# Altium schematic sheet main.SchDoc
size A4; SheetNumber: 1; SheetTotal: 4
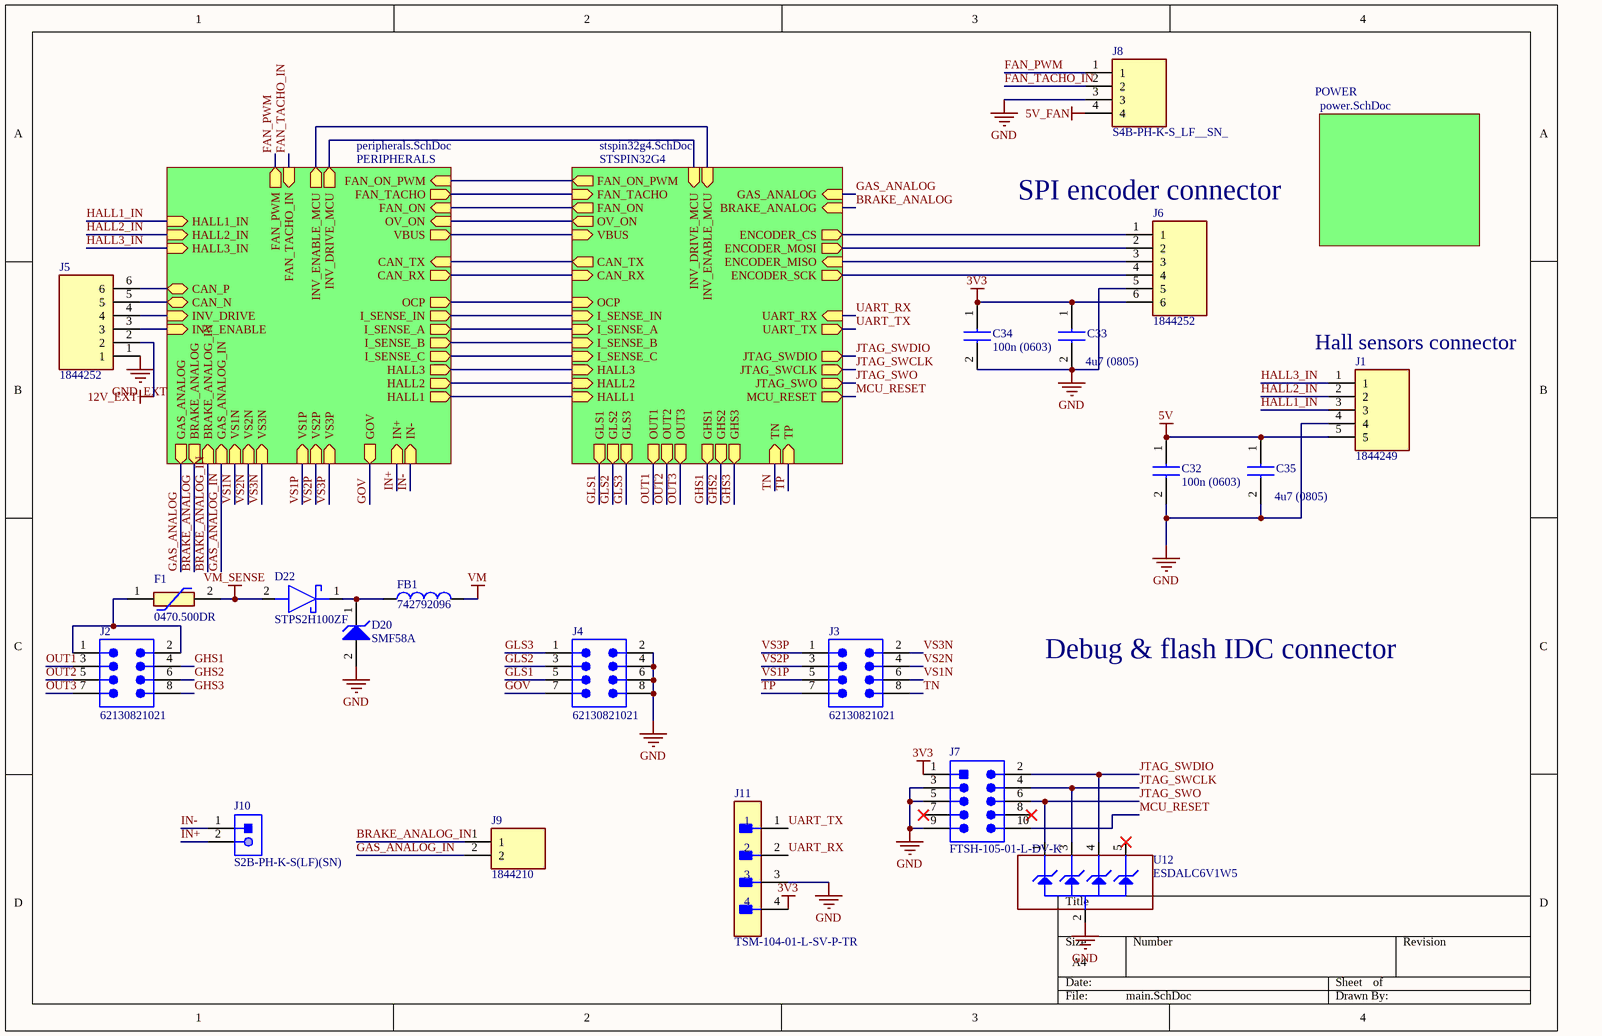
[diagram p0: main.SchDoc]

## Parts
C32  100n (0603)  [C0603]
C33  4u7 (0805)  [C0805]
C34  100n (0603)  [C0603]
C35  4u7 (0805)  [C0805]
D20  SMF58A  [ONSC-SOD-123FL-2-498_V]
D22  STPS2H100ZF  [SODFL3516X110N]
F1  0470.500DR  [1206L075132WR]
FB1  742792096  [WE-CBF_0805_L2W1.2H0.9_HC]
J1  1844249  [SHDRRA5W80P0X350_1X5_1890X920X825P]
J2  62130821021  [62130821021]
J3  62130821021  [62130821021]
J4  62130821021  [62130821021]
J5  1844252  [SHDRRA6W83P0X350_1X6_2240X920X825P]
J6  1844252  [SHDRRA6W83P0X350_1X6_2240X920X825P]
J7  FTSH-105-01-L-DV-K  [SMTC-FTSH-105-01-L-DV-K_V]
J8  S4B-PH-K-S_LF__SN_  [SHDRRA4W50P0X200_1X4_990X760X480P]
J9  1844210  [SHDRRA2W80P0X350_1X2_840X920X825P]
J10  S2B-PH-K-S(LF)(SN)  [JST-S2B-PH-K-S_V]
J11  TSM-104-01-L-SV-P-TR  [FP-TSM-104-01-L-SV-P-TR-MFG]
U12  ESDALC6V1W5  [ESDALC6V1W5]

## Sub-sheets
PERIPHERALS = peripherals.SchDoc: CAN_TX (in), CAN_RX (out), CAN_P (bidir), CAN_N (bidir), VS3N (in), VS2N (in), VS1N (in), VS1P (in), VS2P (in), VS3P (in), I_SENSE_A (out), I_SENSE_B (out), I_SENSE_C (out), I_SENSE_IN (out), OCP (out), VBUS (out), HALL1_IN (in), HALL2_IN (in), HALL3_IN (in), HALL1 (out), HALL2 (out), HALL3 (out), GOV (out), OV_ON (in), FAN_PWM (out), FAN_ON (in), FAN_ON_PWM (in), FAN_TACHO (out), FAN_TACHO_IN (in), IN- (in), IN+ (in), INV_DRIVE (in), INV_ENABLE (in), INV_DRIVE_MCU (out), INV_ENABLE_MCU (out), GAS_ANALOG (out), BRAKE_ANALOG (out), BRAKE_ANALOG_IN (in), GAS_ANALOG_IN (in)
POWER = power.SchDoc: no entries
STSPIN32G4 = stspin32g4.SchDoc: CAN_TX (out), CAN_RX (in), GHS1 (out), GHS2 (out), GHS3 (out), GLS3 (out), GLS2 (out), GLS1 (out), OUT1 (out), OUT2 (out), OUT3 (out), I_SENSE_A (in), I_SENSE_B (in), I_SENSE_C (in), OCP (in), VBUS (in), HALL3 (in), HALL2 (in), HALL1 (in), TN (in), TP (in), MCU_RESET (out), ENCODER_CS (out), ENCODER_SCK (out), ENCODER_MISO (in), ENCODER_MOSI (out), JTAG_SWDIO (out), JTAG_SWCLK (out), JTAG_SWO (out), UART_RX (in), UART_TX (out), I_SENSE_IN (in), OV_ON (out), GAS_ANALOG (in), BRAKE_ANALOG (in), FAN_ON_PWM (out), FAN_TACHO (in), FAN_ON (out), INV_DRIVE_MCU (in), INV_ENABLE_MCU (in)

## Nets
3V3: C33.1 C34.1 J6.6 J7.1 J11.4
5V: C32.1 C35.1 J1.5
5V_FAN: J8.4
12V_EXT: J5.2
GND: C32.2 C33.2 C34.2 C35.2 D20.2(A) J1.4 J4.2 J4.4 J4.6 J4.8 J6.5 J7.3 J7.5 J7.9 J8.3 J11.3 U12.2(GND)
GND_EXT: J5.1
VM: FB1.2
VM_SENSE: D22.2(A) F1.2
BRAKE_ANALOG: sheet PERIPHERALS/BRAKE_ANALOG, sheet STSPIN32G4/BRAKE_ANALOG
BRAKE_ANALOG_IN: J9.1 ; sheet PERIPHERALS/BRAKE_ANALOG_IN
FAN_PWM: J8.1 ; sheet PERIPHERALS/FAN_PWM
FAN_TACHO_IN: J8.2 ; sheet PERIPHERALS/FAN_TACHO_IN
GAS_ANALOG: sheet PERIPHERALS/GAS_ANALOG, sheet STSPIN32G4/GAS_ANALOG
GAS_ANALOG_IN: J9.2 ; sheet PERIPHERALS/GAS_ANALOG_IN
GHS1: J2.4 ; sheet STSPIN32G4/GHS1
GHS2: J2.6 ; sheet STSPIN32G4/GHS2
GHS3: J2.8 ; sheet STSPIN32G4/GHS3
GLS1: J4.5 ; sheet STSPIN32G4/GLS1
GLS2: J4.3 ; sheet STSPIN32G4/GLS2
GLS3: J4.1 ; sheet STSPIN32G4/GLS3
GOV: J4.7 ; sheet PERIPHERALS/GOV
HALL1_IN: J1.3 ; sheet PERIPHERALS/HALL1_IN
HALL2_IN: J1.2 ; sheet PERIPHERALS/HALL2_IN
HALL3_IN: J1.1 ; sheet PERIPHERALS/HALL3_IN
IN+: J10.2 ; sheet PERIPHERALS/IN+
IN-: J10.1 ; sheet PERIPHERALS/IN-
JTAG_SWCLK: J7.4 U12.3(IO2) ; sheet STSPIN32G4/JTAG_SWCLK
JTAG_SWDIO: J7.2 U12.4(IO3) ; sheet STSPIN32G4/JTAG_SWDIO
JTAG_SWO: J7.6 U12.1(IO1) ; sheet STSPIN32G4/JTAG_SWO
MCU_RESET: J7.10 ; sheet STSPIN32G4/MCU_RESET
OUT1: J2.3 ; sheet STSPIN32G4/OUT1
OUT2: J2.5 ; sheet STSPIN32G4/OUT2
OUT3: J2.7 ; sheet STSPIN32G4/OUT3
TN: J3.8 ; sheet STSPIN32G4/TN
TP: J3.7 ; sheet STSPIN32G4/TP
UART_RX: J11.2 ; sheet STSPIN32G4/UART_RX
UART_TX: J11.1 ; sheet STSPIN32G4/UART_TX
VS1N: J3.6 ; sheet PERIPHERALS/VS1N
VS1P: J3.5 ; sheet PERIPHERALS/VS1P
VS2N: J3.4 ; sheet PERIPHERALS/VS2N
VS2P: J3.3 ; sheet PERIPHERALS/VS2P
VS3N: J3.2 ; sheet PERIPHERALS/VS3N
VS3P: J3.1 ; sheet PERIPHERALS/VS3P
NetD20_1: D20.1(K) D22.1(K) FB1.1
NetF1_1: F1.1 J2.1 J2.2
NetJ5_3: J5.3 ; sheet PERIPHERALS/INV_ENABLE
NetJ5_4: J5.4 ; sheet PERIPHERALS/INV_DRIVE
NetJ5_5: J5.5 ; sheet PERIPHERALS/CAN_N
NetJ5_6: J5.6 ; sheet PERIPHERALS/CAN_P
NetJ6_1: J6.1 ; sheet STSPIN32G4/ENCODER_CS
NetJ6_2: J6.2 ; sheet STSPIN32G4/ENCODER_MOSI
NetJ6_3: J6.3 ; sheet STSPIN32G4/ENCODER_MISO
NetJ6_4: J6.4 ; sheet STSPIN32G4/ENCODER_SCK
(unnamed): sheet PERIPHERALS/CAN_TX, sheet STSPIN32G4/CAN_TX
(unnamed): sheet PERIPHERALS/CAN_RX, sheet STSPIN32G4/CAN_RX
(unnamed): sheet PERIPHERALS/I_SENSE_A, sheet STSPIN32G4/I_SENSE_A
(unnamed): sheet PERIPHERALS/I_SENSE_B, sheet STSPIN32G4/I_SENSE_B
(unnamed): sheet PERIPHERALS/I_SENSE_C, sheet STSPIN32G4/I_SENSE_C
(unnamed): sheet PERIPHERALS/I_SENSE_IN, sheet STSPIN32G4/I_SENSE_IN
(unnamed): sheet PERIPHERALS/OCP, sheet STSPIN32G4/OCP
(unnamed): sheet PERIPHERALS/VBUS, sheet STSPIN32G4/VBUS
(unnamed): sheet PERIPHERALS/HALL1, sheet STSPIN32G4/HALL1
(unnamed): sheet PERIPHERALS/HALL2, sheet STSPIN32G4/HALL2
(unnamed): sheet PERIPHERALS/HALL3, sheet STSPIN32G4/HALL3
(unnamed): sheet PERIPHERALS/OV_ON, sheet STSPIN32G4/OV_ON
(unnamed): sheet PERIPHERALS/FAN_ON, sheet STSPIN32G4/FAN_ON
(unnamed): sheet PERIPHERALS/FAN_ON_PWM, sheet STSPIN32G4/FAN_ON_PWM
(unnamed): sheet PERIPHERALS/FAN_TACHO, sheet STSPIN32G4/FAN_TACHO
(unnamed): sheet PERIPHERALS/INV_DRIVE_MCU, sheet STSPIN32G4/INV_DRIVE_MCU
(unnamed): sheet PERIPHERALS/INV_ENABLE_MCU, sheet STSPIN32G4/INV_ENABLE_MCU

Not connected (* = marked no-connect by the designer): J7 7* 8*; U12 5(IO4)*

## Notes on the sheet
- (near J6) SPI encoder connector
- (near J1) Hall sensors connector
- Debug & flash IDC connector

## Library data of the parts
C32 C34 = GCM188R71E104JA57D: CAP CER 0.1UF 25V X7R 0603 / 0.1 μF ±5% 25V Ceramic Capacitor X7R 0603 (1608 Metric); Manufacturer_Name: Murata Electronics; Manufacturer: Murata; Manufacturer Lifecycle Status: NRND; Value: 100nF; Datasheet Link: https://search.murata.co.jp/Ceramy/image/img/A01X/G101/ENG/GCM188R71E104JA57-01A.pdf; Height: 0.9mm; Manufacturer_Part_Number: GCM188R71E104JA57D; Mouser Part Number: 81-GCM188R71E104JAD; Mouser Price/Stock: https://www.mouser.co.uk/ProductDetail/Murata-Electronics/GCM188R71E104JA57D?qs=ui%252B2d9lVEI5lLkZDVYlCng%3D%3D; Arrow Part Number: GCM188R71E104JA57D; Arrow Price/Stock: https://www.arrow.com/en/products/gcm188r71e104ja57d/murata-manufacturing; Supplier: DigiKey; Supplier Part Number: 490-GCM188R71E104JA57DCT-ND; Manufacturer Part Number: GCM188R71E104JA57D; RoHS: Compliant; Category: Ceramic Capacitors; Stock: 2875; Pricing: 1=0,33, 10=0,196, 50=0,1434, 100=0,1272, 500=0,09986, 1000=0,09143 (USD); Case/Package: 0603; Country of Origin: Philippines; Dielectric Material: Ceramic; Export Control Classification Number (ECCN) Code: EAR99; Harmonized Tariff Schedule (HTS) Code: 8532.24.00.20; Introduction Date: 2013-11-20; Length: 1.6mm; Lifecycle Status: NRND; Max Operating Temperature: 125°C; Min Operating Temperature: -55°C; Mounting Technology: Surface Mount; Number of Terminals: 2; Ratings: AEC-Q200; REACH SVHC: Yes; Schedule B: 8532240020, 8532240020|8532240020|8532240020|8532240020|8532240020; Thickness: 800µm; Voltage Rating (DC): 25V; Width: 800µm; ComponentLink1URL: https://datasheet.octopart.com:443/GCM188R71E104JA57D-Murata-datasheet-141267551.pdf?src-supplier=Geoflip; ComponentLink1Description: https://datasheet.octopart.com:443/GCM188R71E104JA57D-Murata-datasheet-141267551.pdf?src-supplier=Geoflip; ComponentLink2URL: https://datasheet.octopart.com:443/GCM188R71E104JA57D-Murata-datasheet-140658663.pdf?src-supplier=Ciiva; ComponentLink2Description: https://datasheet.octopart.com:443/GCM188R71E104JA57D-Murata-datasheet-140658663.pdf?src-supplier=Ciiva; ComponentLink3URL: https://datasheet.octopart.com:443/GCM188R71E104JA57D-Murata-datasheet-138718229.pdf?src-supplier=Ciiva; ComponentLink3Description: https://datasheet.octopart.com:443/GCM188R71E104JA57D-Murata-datasheet-138718229.pdf?src-supplier=Ciiva; ComponentLink4URL: http://sigma.octopart.com:80/reach_statement/Murata-company-16.pdf?src-supplier=Compliance+Statements; ComponentLink4Description: http://sigma.octopart.com:80/reach_statement/Murata-company-16.pdf?src-supplier=Compliance+Statements
C33 C35 = GRM21BZ71E475KE15L: 25V 4.7uF X7R ±10% 0805 Multilayer Ceramic Capacitors MLCC - SMD/SMT ROHS; Manufacturer_Name: Murata Electronics; Manufacturer: Murata; Manufacturer Lifecycle Status: IN PRODUCTION; Value: 4.7µF; Datasheet Link: https://search.murata.co.jp/Ceramy/image/img/A01X/G101/ENG/GRM21BZ71E475KE15-01A.pdf; Height: 1.45mm; Manufacturer_Part_Number: GRM21BZ71E475KE15L; Mouser Part Number: 81-GRM21BZ71E475KE5L; Mouser Price/Stock: https://www.mouser.co.uk/ProductDetail/Murata-Electronics/GRM21BZ71E475KE15L?qs=Ey7%2FXF42M3feXnDNgc%252BFlQ%3D%3D; Arrow Part Number: GRM21BZ71E475KE15L; Arrow Price/Stock: https://www.arrow.com/en/products/grm21bz71e475ke15l/murata-manufacturing?utm_currency=USD&region=nac; Supplier: RS; Supplier Part Number: 2478136; Manufacturer Part Number: GRM21BZ71E475KE15L; RoHS: Compliant; Category: Ceramic Capacitors; Stock: 4700; Case/Package: 0805; Dielectric Material: Ceramic; Export Control Classification Number (ECCN) Code: EAR99; Harmonized Tariff Schedule (HTS) Code: 8532.24.00.20; Introduction Date: 2017-02-22; Length: 2mm; Lifecycle Status: Production; Material: Ceramic; Max Operating Temperature: 125°C; Min Operating Temperature: -55°C; Mounting Technology: Surface Mount; Number of Terminals: 2; REACH SVHC: Yes; Thickness: 1.25mm; Tolerance: 10%; Voltage Rating: 25V; Voltage Rating (DC): 25V; Width: 1.25mm; ComponentLink1URL: https://datasheet.octopart.com:443/GRM21BZ71E475KE15L-Murata-datasheet-155345087.pdf?src-supplier=Newark; ComponentLink1Description: https://datasheet.octopart.com:443/GRM21BZ71E475KE15L-Murata-datasheet-155345087.pdf?src-supplier=Newark; ComponentLink2URL: https://datasheet.octopart.com:443/GRM21BZ71E475KE15L-Murata-datasheet-141278877.pdf?src-supplier=Geoflip; ComponentLink2Description: https://datasheet.octopart.com:443/GRM21BZ71E475KE15L-Murata-datasheet-141278877.pdf?src-supplier=Geoflip; ComponentLink3URL: https://datasheet.octopart.com:443/GRM21BZ71E475KE15L-Murata-datasheet-165579666.pdf?src-supplier=TME; ComponentLink3Description: https://datasheet.octopart.com:443/GRM21BZ71E475KE15L-Murata-datasheet-165579666.pdf?src-supplier=TME; ComponentLink4URL: https://datasheet.octopart.com:443/GRM21BZ71E475KE15L-Murata-datasheet-140707839.pdf?src-supplier=Ciiva; ComponentLink4Description: https://datasheet.octopart.com:443/GRM21BZ71E475KE15L-Murata-datasheet-140707839.pdf?src-supplier=Ciiva; ComponentLink5URL: https://datasheet.octopart.com:443/GRM21BZ71E475KE15L-Murata-datasheet-138745135.pdf?src-supplier=Ciiva; ComponentLink5Description: https://datasheet.octopart.com:443/GRM21BZ71E475KE15L-Murata-datasheet-138745135.pdf?src-supplier=Ciiva; ComponentLink6URL: http://sigma.octopart.com:80/reach_statement/Murata-company-16.pdf?src-supplier=Compliance+Statements; ComponentLink6Description: http://sigma.octopart.com:80/reach_statement/Murata-company-16.pdf?src-supplier=Compliance+Statements
D20 = CMP-1061-00608-1: 200 W Transient Voltage Suppressor, 2-Pin SOD-123FL, Pb-Free, Tape and Reel; Manufacturer: On Semiconductor; PartNumber: SMF58AT1G; Direction: Unidirectional; IR Max (uA): 1; V(BR) Typ (V): 67.8; ComponentLink2URL: http://www.onsemi.com/pub_link/Collateral/SMF5.0AT1-D.PDF; Packing: Tape and Reel; DatasheetVersion: Rev. 7; PackageReference: SOD-123FL-2-498; ComponentLink2Description: Datasheet; RoHS: Pb-Free; ComponentLink3Description: Package Specification; PackageVersion: Rev. D, 05/2013; ComponentLink1URL: http://www.onsemi.com/; ComponentLink3URL: http://www.onsemi.com/pub_link/Collateral/498-01.PDF; PackageDescription: 2-Pin SOD, Body 1.65 x 2.7 mm; Mounting Technology: Surface Mount; ComponentLink1Description: Manufacturer URL
D22 = STPS2H100ZF: Schottky Diode; Manufacturer_Name: STMicroelectronics; Datasheet Link: https://www.st.com/resource/en/datasheet/stps2h100zf.pdf; Height: 1.1mm; Manufacturer_Part_Number: STPS2H100ZF; Mouser Part Number: 511-STPS2H100ZF; Mouser Price/Stock: https://www.mouser.co.uk/ProductDetail/STMicroelectronics/STPS2H100ZF?qs=BAoXHaCe4Em%2FfzC%252BFY2Wew%3D%3D; Arrow Part Number: STPS2H100ZF; Arrow Price/Stock: https://www.arrow.com/en/products/stps2h100zf/stmicroelectronics?utm_currency=USD&region=nac
F1 = 1206L110_16WR: Resettable Fuse; Manufacturer_Name: LITTELFUSE; Manufacturer_Part_Number: 1206L110/16WR; Datasheet Link: https://www.littelfuse.com/~/media/electronics/datasheets/resettable_ptcs/littelfuse_ptc_1206l_datasheet.pdf.pdf; Height: 1.25mm; Mouser Part Number: 576-1206L110/16WR; Mouser Price/Stock: https://www.mouser.co.uk/ProductDetail/Littelfuse/1206L110-16WR?qs=TVaBpCI%2FeOi62RF5AFEWSA%3D%3D; Arrow Part Number: 1206L110/16WR; Arrow Price/Stock: https://www.arrow.com/en/products/1206l11016wr/littelfuse?utm_currency=USD&region=nac
FB1 = CMP-0220-00166-2: NexarPartId: 8916991; Impedance: 1kΩ; Inductance: 2.2H; Current Rating: 1A; Tolerance: 25%; Resistance: 300mΩ; Number of Lines: 1; Test Frequency: 100MHz; Termination: SMD/SMT; REACH SVHC: Unknown; Depth: 1.2mm; Case Code (Imperial): 0805; Case/Package: SMD/SMT; RoHS: Compliant; Material: Ferrite; Max Current Rating: 1A; Width: 1.2mm; Packaging: Digi-Reel®; Lead Free: Lead Free; Height: 900µm; Core Material: Ferrite; Weight: 5.499807mg; Max DC Current: 1A; Min Operating Temperature: -55°C; Max Operating Temperature: 125°C; Mount: Surface Mount; Length: 2mm; Case Code (Metric): 2012; DC Resistance (DCR): 300mΩ
J1 = 1844249: Connector; Manufacturer_Name: Phoenix Contact; Datasheet Link: https://www.phoenixcontact.com/en-us/products/pcb-header-mc-15-5-g-35-1844249?type=pdf; Height: 8.25mm; Manufacturer_Part_Number: 1844249; Mouser Part Number: 651-1844249; Mouser Price/Stock: https://www.mouser.co.uk/ProductDetail/Phoenix-Contact/1844249?qs=wd%252Bw3mUqFrkyoPkI2iC2Lg%3D%3D; Arrow Part Number: 1844249; Arrow Price/Stock: https://www.arrow.com/en/products/1844249/phoenix-contact.html?utm_currency=USD&region=nac
J2-J4 = CMP-03913-122375878-3: Conn, Header, 8Pos, 2Row, 1.27Mm Rohs Compliant: Yes; Current Rating: 1A; Number of Contacts: 8; Voltage Rating: 100V; Max Operating Temperature: 105°C; Number of Rows: 2; RoHS: Compliant; Contact Material: Gold; Height: 6.4mm; Min Operating Temperature: -40°C
J5 J6 = 1844252: Connector; Manufacturer_Name: Phoenix Contact; Datasheet Link: https://www.phoenixcontact.com/en-us/products/pcb-header-mc-15-6-g-35-1844252?type=pdf; Height: 8.25mm; Manufacturer_Part_Number: 1844252; Mouser Part Number: 651-1844252; Mouser Price/Stock: https://www.mouser.co.uk/ProductDetail/Phoenix-Contact/1844252?qs=8BCRtFWWXOQ9wOLoIUfCgg%3D%3D; Arrow Part Number: 1844252; Arrow Price/Stock: https://www.arrow.com/en/products/1844252/phoenix-contact?utm_currency=USD&region=nac
J7 = CMP-2000-05353-1: Male Header, Pitch 1.27 mm, 2 x 5 Position, Height 6.25 mm; Manufacturer: Samtec; Pitch: 0.050"(1.27mm); Other Names: Q3937619; Number of Positions: 10; Mating Products: SFMC-105-L2-S-D-TR-ND / -CONN.05"SURFACE10POSSMT / FLE-105-01-G-DV-TR-ND / -CONNSKT1.27MM10POSDUALSMD / FLE-105-01-G-DV-A-P-ND / -CONNSKT1.27MM10POSDUALSMD / FLE-105-01-G-DV-A-ND / -CONNSKT1.27MM10POSDUALSMD / CLP-105-02-G-D-P-TR-ND / -CONNRCPT10POSDUAL.05"SMD / SAM1155-05-ND / -CONNRCPT10POSDUAL.05"SMD / SAM1154-05-ND / -CONNRCPT10POSDUAL.05"SMD / SAM1153-05-ND / -CONNRCPT10POSDUAL.05"SMD / SAM1226-05-ND / -CONNRCPT.05"10POSDUALSMD; Number of Positions Loaded: All; Connector Type: Header,Unshrouded; Product Training Modules: Board-to-BoardConnectors; Datasheet Version: Rev. ET, 10/1995; Number of Rows: 2; Standard Package: 1; Package Description: Male Header, Pitch 1.27 mm, 2 x 5 Position, Height 5.97 mm, Tail Length 4.32 mm; Contact Finish Thickness: 10µin(0.25µm); Series: FTSH; Termination: Solder; Contact Type: MalePin; Color: Black; Package Reference: FTSH-105-01-L-DV-K; Family: RectangularConnectors-Headers,MalePins; Package URL: http://suddendocs.samtec.com/prints/ftsh-1xx-xx-xxx-dv-xxx-footprint.pdf; Packaging: Tube; Mounting Type: SurfaceMount; Category: Connectors,Interconnects; Datasheet URL: http://suddendocs.samtec.com/prints/ftsh-1xx-xx-xxx-dv-xxx-mkt.pdf; Row Spacing: 0.050"(1.27mm); Manufacturer URL: http://www.samtec.com/; Contact Mating Length: 0.120"(3.05mm); Contact Finish: Gold
J8 = S4B-PH-K-S_LF__SN_: Connector; Manufacturer_Name: JST (JAPAN SOLDERLESS TERMINALS); Manufacturer_Part_Number: S4B-PH-K-S(LF)(SN); Datasheet Link: https://datasheet.lcsc.com/szlcsc/JST-Sales-America-PHsocket-1-4P-Curved-needle-pitch2mm_C157926.pdf; Height: 4.8mm; Mouser Part Number: N/A; Mouser Price/Stock: https://www.mouser.co.uk/ProductDetail/JST-Commercial/S4B-PH-K-SLFSN?qs=QpmGXVUTftEGA16rwNx4xw%3D%3D; Arrow Part Number: S4B-PH-K-S(LF)(SN); Arrow Price/Stock: https://www.arrow.com/en/products/s4b-ph-k-s-lf-sn/jst-manufacturing.html?utm_currency=USD&region=europe
J9 = 1844210: Connector; Manufacturer_Name: Phoenix Contact; Datasheet Link: https://www.phoenixcontact.com/en-us/products/pcb-header-mc-15-2-g-35-1844210?type=pdf; Height: 8.25mm; Manufacturer_Part_Number: 1844210; Mouser Part Number: 651-1844210; Mouser Price/Stock: https://www.mouser.co.uk/ProductDetail/Phoenix-Contact/1844210?qs=8BCRtFWWXORb3OQRdxIGVQ%3D%3D; Arrow Part Number: 1844210; Arrow Price/Stock: https://www.arrow.com/en/products/1844210/phoenix-contact?utm_currency=USD&region=nac
J10 = CMP-1755-00004-1: Male Header, Pitch 2 mm, 1 x 2 Position, Height 4.8 mm, Tail Length 3.4 mm, -25 to 85 degC, RoHS, Bulk; Case\Package: Radial; Tolerance: 20%; Capacitance: 10 uF; Voltage Rating (DC): 50 V; Packaging: Bulk; ComponentLink1URL: http://www.jst-mfg.com/product/pdf/eng/ePH.pdf; Radiation Hardening: No; Height: 11 mm; Package Quantity: 200; PackageDescription: Male Header, Pitch 2 mm, 1 x 2 Position, Height 4.8 mm, Tail Length 3.4 mm; PackageReference: S2B-PH-K-S; Diameter: 5 mm; Pins: 2; Mount: Through Hole; Max Operating Temperature: 85 degC; Min Operating Temperature: -40 degC; ComponentLink1Description: Datasheet; DatasheetVersion: Dec-12; Length: 11 mm; Lead Pitch: 2 mm; REACH SVHC: No SVHC; Voltage Rating: 50 V; RoHSCompliant: true
J11 = CMP-02766-000011-1: CONN HEADER SMD 4POS 2.54MM; Manufacturer: Samtec; Number Of Contacts: 4; Conn Gender: Male; Standoff Height: 0.04inch; Conn Orientation: Vertical; Current Rating: 5.4A; Voltage Rating: 475V; Manufacturer Part Number: TSM-104-01-L-SV-P-TR; Contact Material: Gold,Nickel; RoHS: TRUE; ComponentLink2URL: http://suddendocs.samtec.com/prints/tsm-1xx-xx-xxx-sv-xx-xxx-xx-mkt.pdf; Package: TSM-104-01-L-SV-P-TR; Lead Free: Yes; Automotive: No; Category: Conn; Digikey Description: CONN HEADER SMD 4POS 2.54MM; ComponentLink2Description: Datasheet; Temperature: -55°C to +125°C; Height: 0.403inch; Device Class L1: Connectors; Device Class L3: unset; Octopart: https://octopart.com/tsm-104-01-l-sv-p-tr-samtec-6805355; Pitch: 2.54mm; Footprint Url: http://suddendocs.samtec.com/prints/tsm-1xx-xx-xx-sv-xx-xxx-xx-footprint.pdf; Device Class L2: Headers and Wire Housings; Temperature Range Low: -55°C; Number Of Rows: 1; Temperature Range High: +125°C
U12 = ESDALC6V1W5: Dual Transil array for ESD protection; Internal_Part_Number: MCD-00136; Part_Type: Diode; Manufacturer: STMICROELECTRONICS; ECCN_US: EAR99; ECCN_EU: NEC; Provided_By: Subcon; Initial_Board_Reference: MB1262; Status: Released; Manufacturer_Part_Number: ESDALC6V1W5; ComponentLink1Description: STM_ESD_ESDALC6V1W5.pdf; ComponentLink1URL: http://tunmcdsvn.tun.st.com/Component_Datasheet_Library/Trunk/Diodes/STM_ESD_ESDALC6V1W5; Value: ESDALC6V1W5